# Altium schematic sheet Peripherals.SchDoc
size A3
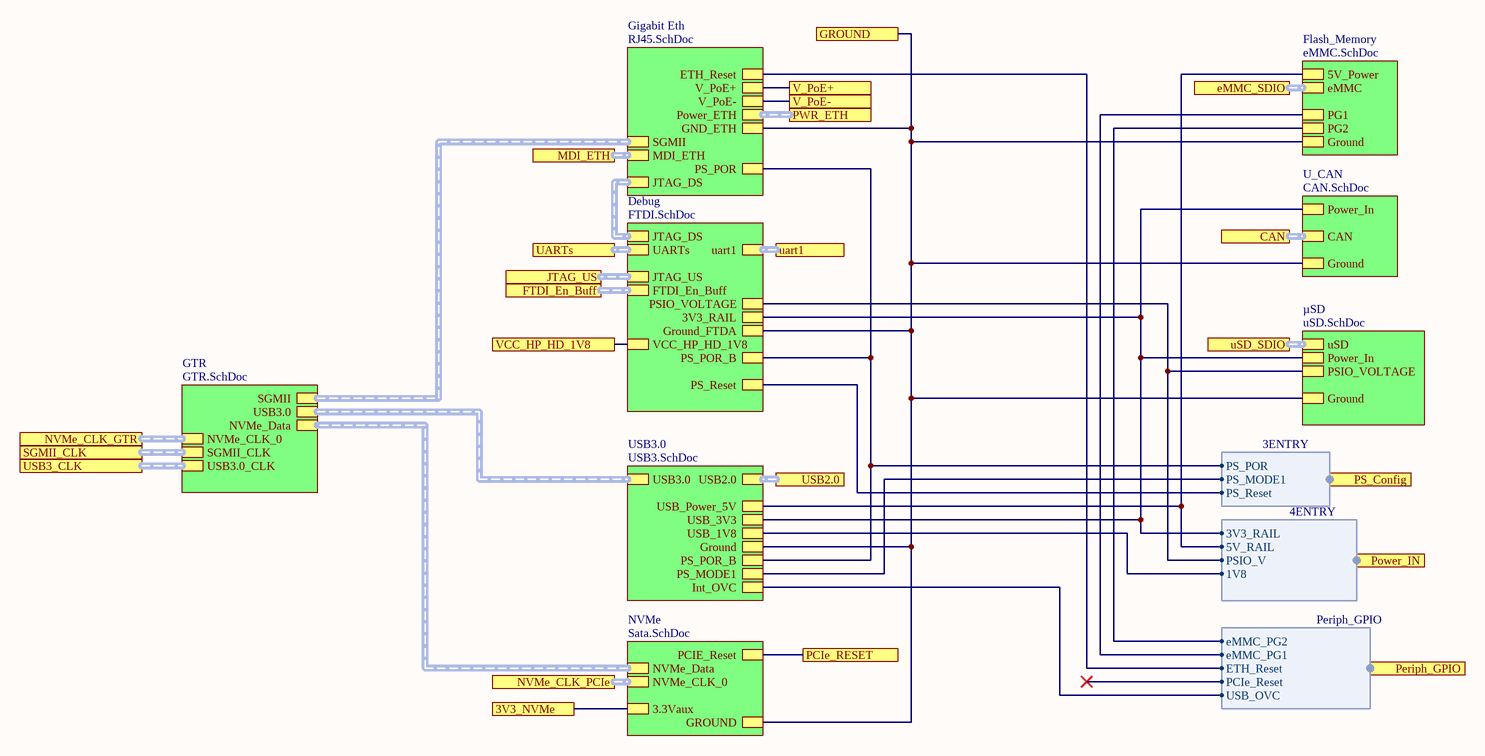
[diagram p0: Peripherals.SchDoc]

## Sub-sheets
Debug = FTDI.SchDoc: uart1 (harness uart), UARTs (harness 2Uarts), JTAG_US (harness JTAG), JTAG_DS (harness JTAG), PSIO_VOLTAGE, PS_POR_B, PS_Reset, 3V3_RAIL, Ground_FTDA, VCC_HP_HD_1V8, FTDI_En_Buff (harness FTDI_En_Buff)
Flash_Memory = eMMC.SchDoc: 5V_Power, Ground, eMMC (harness SDIO_H), PG2, PG1
Gigabit Eth = RJ45.SchDoc: JTAG_DS (harness JTAG), SGMII (harness Diff_2PairData), V_PoE-, V_PoE+, Power_ETH (harness Power_ETH), MDI_ETH (harness MDI_ETH), PS_POR, ETH_Reset, GND_ETH
GTR = GTR.SchDoc: USB3.0 (harness Diff_2PairData), NVMe_Data (harness NVMe_Data), SGMII (harness Diff_2PairData), SGMII_CLK (harness Diff_1Pair), USB3.0_CLK (harness Diff_1Pair), NVMe_CLK_0 (harness Diff_1Pair)
NVMe = Sata.SchDoc: NVMe_CLK_0 (harness Diff_1Pair), NVMe_Data (harness NVMe_Data), GROUND, 3.3Vaux, PCIE_Reset
U_CAN = CAN.SchDoc: Power_In, Ground, CAN (harness CAN)
USB3.0 = USB3.SchDoc: USB3.0 (harness Diff_2PairData), USB2.0 (harness USB_H), USB_1V8, USB_Power_5V, Ground, USB_3V3, PS_MODE1, PS_POR_B, Int_OVC
µSD = uSD.SchDoc: uSD (harness SDIO_H), Ground, Power_In, PSIO_VOLTAGE

## Ports
3V3_NVMe, CAN (harness CAN), eMMC_SDIO (harness SDIO_H), FTDI_En_Buff (harness FTDI_En_Buff), GROUND, JTAG_US (harness JTAG), MDI_ETH (harness MDI_ETH), NVMe_CLK_GTR (harness Diff_1Pair), NVMe_CLK_PCIe (harness Diff_1Pair), PCIe_RESET, Periph_GPIO (harness Periph_GPIO), Power_IN (harness 4ENTRY), PS_Config (harness 3ENTRY), PWR_ETH (harness Power_ETH), SGMII_CLK (harness Diff_1Pair), uart1 (harness uart), UARTs (harness 2Uarts), USB2.0 (harness USB_H), USB3_CLK (harness Diff_1Pair), uSD_SDIO (harness SDIO_H), V_PoE+, V_PoE-, VCC_HP_HD_1V8

## Harnesses
4ENTRY: 3V3_RAIL, 5V_RAIL, PSIO_V, 1V8
3ENTRY: PS_POR, PS_MODE1, PS_Reset
Periph_GPIO: eMMC_PG2, eMMC_PG1, ETH_Reset, PCIe_Reset, USB_OVC

## Nets
3V3_NVMe: port 3V3_NVMe, sheet NVMe/3.3Vaux
GROUND: port GROUND, sheet Gigabit Eth/GND_ETH, sheet NVMe/GROUND, sheet µSD/Ground, sheet Debug/Ground_FTDA, sheet USB3.0/Ground, sheet U_CAN/Ground, sheet Flash_Memory/Ground
PCIe_RESET: port PCIe_RESET, sheet NVMe/PCIE_Reset
V_PoE+: port V_PoE+, sheet Gigabit Eth/V_PoE+
V_PoE-: port V_PoE-, sheet Gigabit Eth/V_PoE-
VCC_HP_HD_1V8: port VCC_HP_HD_1V8, sheet Debug/VCC_HP_HD_1V8
(unnamed): sheet Gigabit Eth/PS_POR, sheet Debug/PS_POR_B, sheet USB3.0/PS_POR_B, port PS_Config.PS_POR
(unnamed): sheet Gigabit Eth/ETH_Reset, port Periph_GPIO.ETH_Reset
(unnamed): sheet µSD/Power_In, sheet Debug/3V3_RAIL, sheet USB3.0/USB_3V3, sheet U_CAN/Power_In, port Power_IN.3V3_RAIL
(unnamed): sheet µSD/PSIO_VOLTAGE, sheet Debug/PSIO_VOLTAGE, port Power_IN.PSIO_V
(unnamed): sheet Debug/PS_Reset, port PS_Config.PS_Reset
(unnamed): sheet USB3.0/USB_1V8, port Power_IN.1V8
(unnamed): sheet USB3.0/USB_Power_5V, sheet Flash_Memory/5V_Power, port Power_IN.5V_RAIL
(unnamed): sheet USB3.0/PS_MODE1, port PS_Config.PS_MODE1
(unnamed): sheet USB3.0/Int_OVC, port Periph_GPIO.USB_OVC
(unnamed): sheet Flash_Memory/PG2, port Periph_GPIO.eMMC_PG2
(unnamed): sheet Flash_Memory/PG1, port Periph_GPIO.eMMC_PG1

## Buses and harness runs
harness port CAN = sheet U_CAN/CAN
harness port eMMC_SDIO = sheet Flash_Memory/eMMC
harness port FTDI_En_Buff = sheet Debug/FTDI_En_Buff
harness port JTAG_US = sheet Debug/JTAG_US
harness port MDI_ETH = sheet Gigabit Eth/MDI_ETH
harness port NVMe_CLK_GTR = sheet GTR/NVMe_CLK_0
harness port NVMe_CLK_PCIe = sheet NVMe/NVMe_CLK_0
harness port PWR_ETH = sheet Gigabit Eth/Power_ETH
harness port SGMII_CLK = sheet GTR/SGMII_CLK
harness port uart1 = sheet Debug/uart1
harness port UARTs = sheet Debug/UARTs
harness port USB2.0 = sheet USB3.0/USB2.0
harness port USB3_CLK = sheet GTR/USB3.0_CLK
harness port uSD_SDIO = sheet µSD/uSD
harness sheet Debug/JTAG_DS = sheet Gigabit Eth/JTAG_DS
harness sheet Gigabit Eth/SGMII = sheet GTR/SGMII
harness sheet GTR/NVMe_Data = sheet NVMe/NVMe_Data
harness sheet GTR/USB3.0 = sheet USB3.0/USB3.0

## Notes on the sheet
- Title
- Size:
- Date:
- A3
- Number:
- Time:
- Revision:
- Sheet
- of
- File: